# Altium schematic sheet DECODER.SchDoc
size A4; SheetNumber: 2; SheetTotal: 2
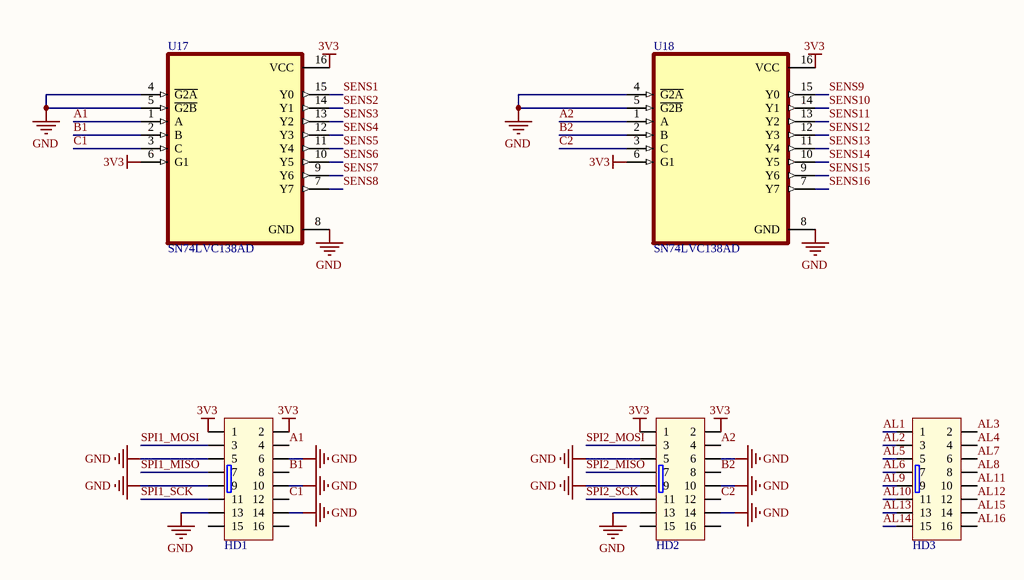
[diagram p0: DECODER.SchDoc]

## Parts
HD1  IDC 8X2  [IDC16]  (value not drawn)
HD2  IDC 8X2  [IDC16]  (value not drawn)
HD3  IDC 8X2  [IDC16]  (value not drawn)
U17  SN74LVC138AD  [SOIC127P600X175-16N]
U18  SN74LVC138AD  [SOIC127P600X175-16N]

## Nets
3V3: HD1.1 HD1.2 HD2.1 HD2.2 U17.6(G1) U17.16(VCC) U18.6(G1) U18.16(VCC)
GND: HD1.5 HD1.6 HD1.9 HD1.10 HD1.13 HD1.14 HD2.5 HD2.6 HD2.9 HD2.10 HD2.13 HD2.14 U17.4(~{G2A}) U17.5(~{G2B}) U17.8(GND) U18.4(~{G2A}) U18.5(~{G2B}) U18.8(GND)
A1: HD1.4 U17.1(A)
A2: HD2.4 U18.1(A)
AL1: HD3.1
AL2: HD3.3
AL3: HD3.2
AL4: HD3.4
AL5: HD3.5
AL6: HD3.7
AL7: HD3.6
AL8: HD3.8
AL9: HD3.9
AL10: HD3.11
AL11: HD3.10
AL12: HD3.12
AL13: HD3.13
AL14: HD3.15
AL15: HD3.14
AL16: HD3.16
B1: HD1.8 U17.2(B)
B2: HD2.8 U18.2(B)
C1: HD1.12 U17.3(C)
C2: HD2.12 U18.3(C)
SENS1: U17.15(Y0)
SENS2: U17.14(Y1)
SENS3: U17.13(Y2)
SENS4: U17.12(Y3)
SENS5: U17.11(Y4)
SENS6: U17.10(Y5)
SENS7: U17.9(Y6)
SENS8: U17.7(Y7)
SENS9: U18.15(Y0)
SENS10: U18.14(Y1)
SENS11: U18.13(Y2)
SENS12: U18.12(Y3)
SENS13: U18.11(Y4)
SENS14: U18.10(Y5)
SENS15: U18.9(Y6)
SENS16: U18.7(Y7)
SPI1_MISO: HD1.7
SPI1_MOSI: HD1.3
SPI1_SCK: HD1.11
SPI2_MISO: HD2.7
SPI2_MOSI: HD2.3
SPI2_SCK: HD2.11

Not connected (* = marked no-connect by the designer): HD1 15 16; HD2 15 16

## Library data of the parts
HD1-HD3 = IDC 8x2: Value: Header 5x2
U17 U18 = SN74LVC138AD: 3-Line To 8-Line decoder/Demultiplexer; MF: Texas Instruments; SnapEDA_Link: https://www.snapeda.com/parts/SN74LVC138AD/Texas+Instruments/view-part/?ref=snap; Package: SOIC-16 Texas Instruments; Value: *; MP: SN74LVC138AD; Check_prices: https://www.snapeda.com/parts/SN74LVC138AD/Texas+Instruments/view-part/?ref=eda